# Altium schematic sheet DAC_Section.SchDoc
size A4; SheetNumber: 7; SheetTotal: 7
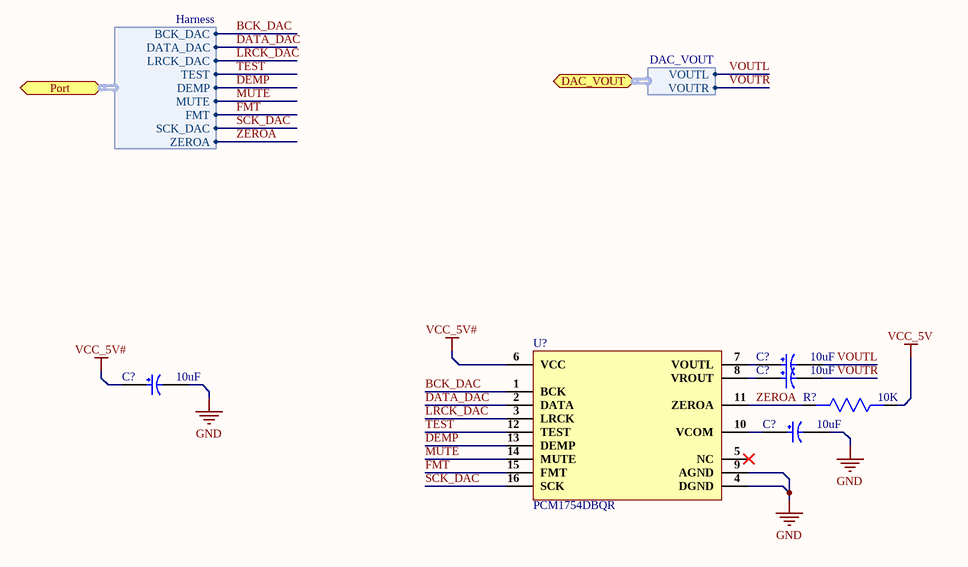
[diagram p0: DAC_Section.SchDoc]

## Parts
(Parts that share a designator on the sheet are numbered #1, #2 ... from top to bottom, then left to right.)
C?#1  10uF  [RVT1E100M0405.]
C?#2  10uF  [RVT1E100M0405.]
C?#3  10uF  [RVT1E100M0405.]
C?#4  10uF  [RVT1E100M0405.]
R?  10K  [Res0603]
U?  PCM1754DBQR  [16-SSOP]

## Ports
DAC_VOUT (bidir, harness DAC_VOUT), Port (bidir, harness Harness)

## Harnesses
Harness: BCK_DAC, DATA_DAC, LRCK_DAC, TEST, DEMP, MUTE, FMT, SCK_DAC, ZEROA
DAC_VOUT: VOUTL, VOUTR

## Nets
GND: C?#3.2 C?#4.2 U?.4(DGND) U?.9(AGND)
VCC_5V: R?.1
VCC_5V#: C?#3.1 U?.6(VCC)
BCK_DAC: U?.1(BCK) ; port Port.BCK_DAC
DATA_DAC: U?.2(DATA) ; port Port.DATA_DAC
DEMP: U?.13(DEMP) ; port Port.DEMP
FMT: U?.15(FMT) ; port Port.FMT
LRCK_DAC: U?.3(LRCK) ; port Port.LRCK_DAC
MUTE: U?.14(MUTE) ; port Port.MUTE
SCK_DAC: U?.16(SCK) ; port Port.SCK_DAC
TEST: U?.12(TEST) ; port Port.TEST
VOUTL: C?#1.2 ; port DAC_VOUT.VOUTL
VOUTR: C?#2.2 ; port DAC_VOUT.VOUTR
ZEROA: R?.2 U?.11(ZEROA) ; port Port.ZEROA
NetC?#1_1: C?#1.1 U?.7(VOUTL)
NetC?#2_1: C?#2.1 U?.8(VROUT)
NetC?#4_1: C?#4.1 U?.10(VCOM)

Not connected (* = marked no-connect by the designer): U? 5(NC)*

## Notes on the sheet
- 1
- Huzaifa Ali

## Library data of the parts
C?#1-C?#4 = RVT1E100M0405: CAP ALUM 10uF 25V SMD; Manufacturer: ROQANG; φD: 4mm; L: 5.4mm; Tolerance: ±20%; Operating Temperature: -45℃~+105℃; Rated Voltage: 25V; Capacitance: 10uF
R? = AC0603JR-0710KL: RES SMD 10K OHM 5% 1/10W 0603; Manufacturer: Yageo; Voltage Rating: 50V; Resistance: 10kR; Power Rating: 100mW; Temperature Coefficient: 100ppm/°C; Supplier 1: Future Electronics; Manufacturer Part Number: AC0603JR-0710KL; RoHS: Yes; Category: Chip SMD Resistors; Stock 1: 1533000; Pricing 1: 5000=0.00540 (USD); Case/Package: 0603; Case Code (Imperial): 0603; Case Code (Metric): 1608; Size Code: 0603; Min Operating Temperature: -55°C; Max Operating Temperature: 155°C; Packaging: Tape and Reel; Tolerance: 5%; Package Quantity: 1; Resistor Type: Thick Film; Termination: SMD/SMT; Number of Terminations: 2; Max Power Dissipation: 100mW; Features: Moisture Resistant,Automotive AEC-Q200,Anti-Sulfur; Series: AC; Construction: Rectangular; Length: 0.063inch; Width: 0.031inch; Height: 0.022inch; Depth: 0.8mm; Military Standard: Not; Lead Free: Lead Free; RoHS Compliant: Yes; ComponentLink1URL: https://datasheet.ciiva.com/5562/pyu-ac-51-rohs-l-2-5562553.pdf?src-supplier=Mouser; ComponentLink1Description: https://datasheet.ciiva.com/5562/pyu-ac-51-rohs-l-2-5562553.pdf?src-supplier=Mouser; Supplier Part Number 1: 1029044
U? = PCM1754DBQR: IC DAC/AUDIO 24BIT 200K 16SSOP; Manufacturer: Texas Instruments; Number of DAC Channels: 2; Operating Supply Voltage: 5V; Max Power Dissipation: 105mW; Interface: Serial,3-WIRE; Number of Bits: 24; Sampling Rate: 192000S/s; Resolution: 24b; Signal to Noise Ratio (SNR): 106dB; Supply Type: Single; Conversion Rate: 192KS/s; Nominal Supply Current: 30mA; Power Consumption: 80mW; Number of Analog Inputs: 0; Output Type: Voltage; Min Supply Voltage: 4.5V; Max Supply Voltage: 5.5V; Integral Nonlinearity (INL): 0.5LSB; Polarity: Bipolar; Supplier 1: Mouser; Manufacturer Part Number: PCM1754DBQR; RoHS: Yes; Category: Amplifiers - Audio; Stock 1: 908; Pricing 1: 1=2.14000, 10=1.93000, 25=1.82000, 50=1.82000, 100=1.55000, 250=1.46000, 500=1.28000, 1000=1.06000, 10000=1.06000 (USD); Mount: Surface Mount; Case/Package: SSOP; Number of Pins: 16; Weight: 0.002603oz; Contact Plating: Gold; Min Operating Temperature: -40°C; Max Operating Temperature: 85°C; Packaging: Tape and Reel; Number of Channels: 2; Package Quantity: 2000; Number of Converters: 2; Number of Analog Outputs: 2; Series: PCM1754; Output Polarity: Bipolar; Length: 5mm; Width: 4mm; Height: 1.5mm; Radiation Hardening: No; Lead Free: Lead Free; RoHS Compliant: Yes; ComponentLink1URL: https://datasheet.ciiva.com/41460/001186173-da-01-en-ic-dac-24bit-mon-pcm1754dbqr-ssop-16-tid-41460109.pdf?src-supplier=Conrad; ComponentLink1Description: https://datasheet.ciiva.com/41460/001186173-da-01-en-ic-dac-24bit-mon-pcm1754dbqr-ssop-16-tid-41460109.pdf?src-supplier=Conrad; ComponentLink2URL: https://datasheet.ciiva.com/1388/pcm1753-1388404.pdf?src-supplier=Digi-Key; ComponentLink2Description: https://datasheet.ciiva.com/1388/pcm1753-1388404.pdf?src-supplier=Digi-Key; ComponentLink3URL: https://datasheet.ciiva.com/1388/pcm1753-1388403.pdf?src-supplier=Digi-Key; ComponentLink3Description: https://datasheet.ciiva.com/1388/pcm1753-1388403.pdf?src-supplier=Digi-Key; ComponentLink4URL: https://datasheet.ciiva.com/1388/pcm1753-1388405.pdf?src-supplier=Digi-Key; ComponentLink4Description: https://datasheet.ciiva.com/1388/pcm1753-1388405.pdf?src-supplier=Digi-Key; ComponentLink5URL: https://datasheet.ciiva.com/15146/getdatasheetpartid-213919-15146955.pdf?src-supplier=Verical; ComponentLink5Description: https://datasheet.ciiva.com/15146/getdatasheetpartid-213919-15146955.pdf?src-supplier=Verical; Supplier Part Number 1: 595-PCM1754DBQR